# Altium schematic sheet PSOC_ControllerSchDoc.SchDoc
size A3; SheetNumber: 3; SheetTotal: 7
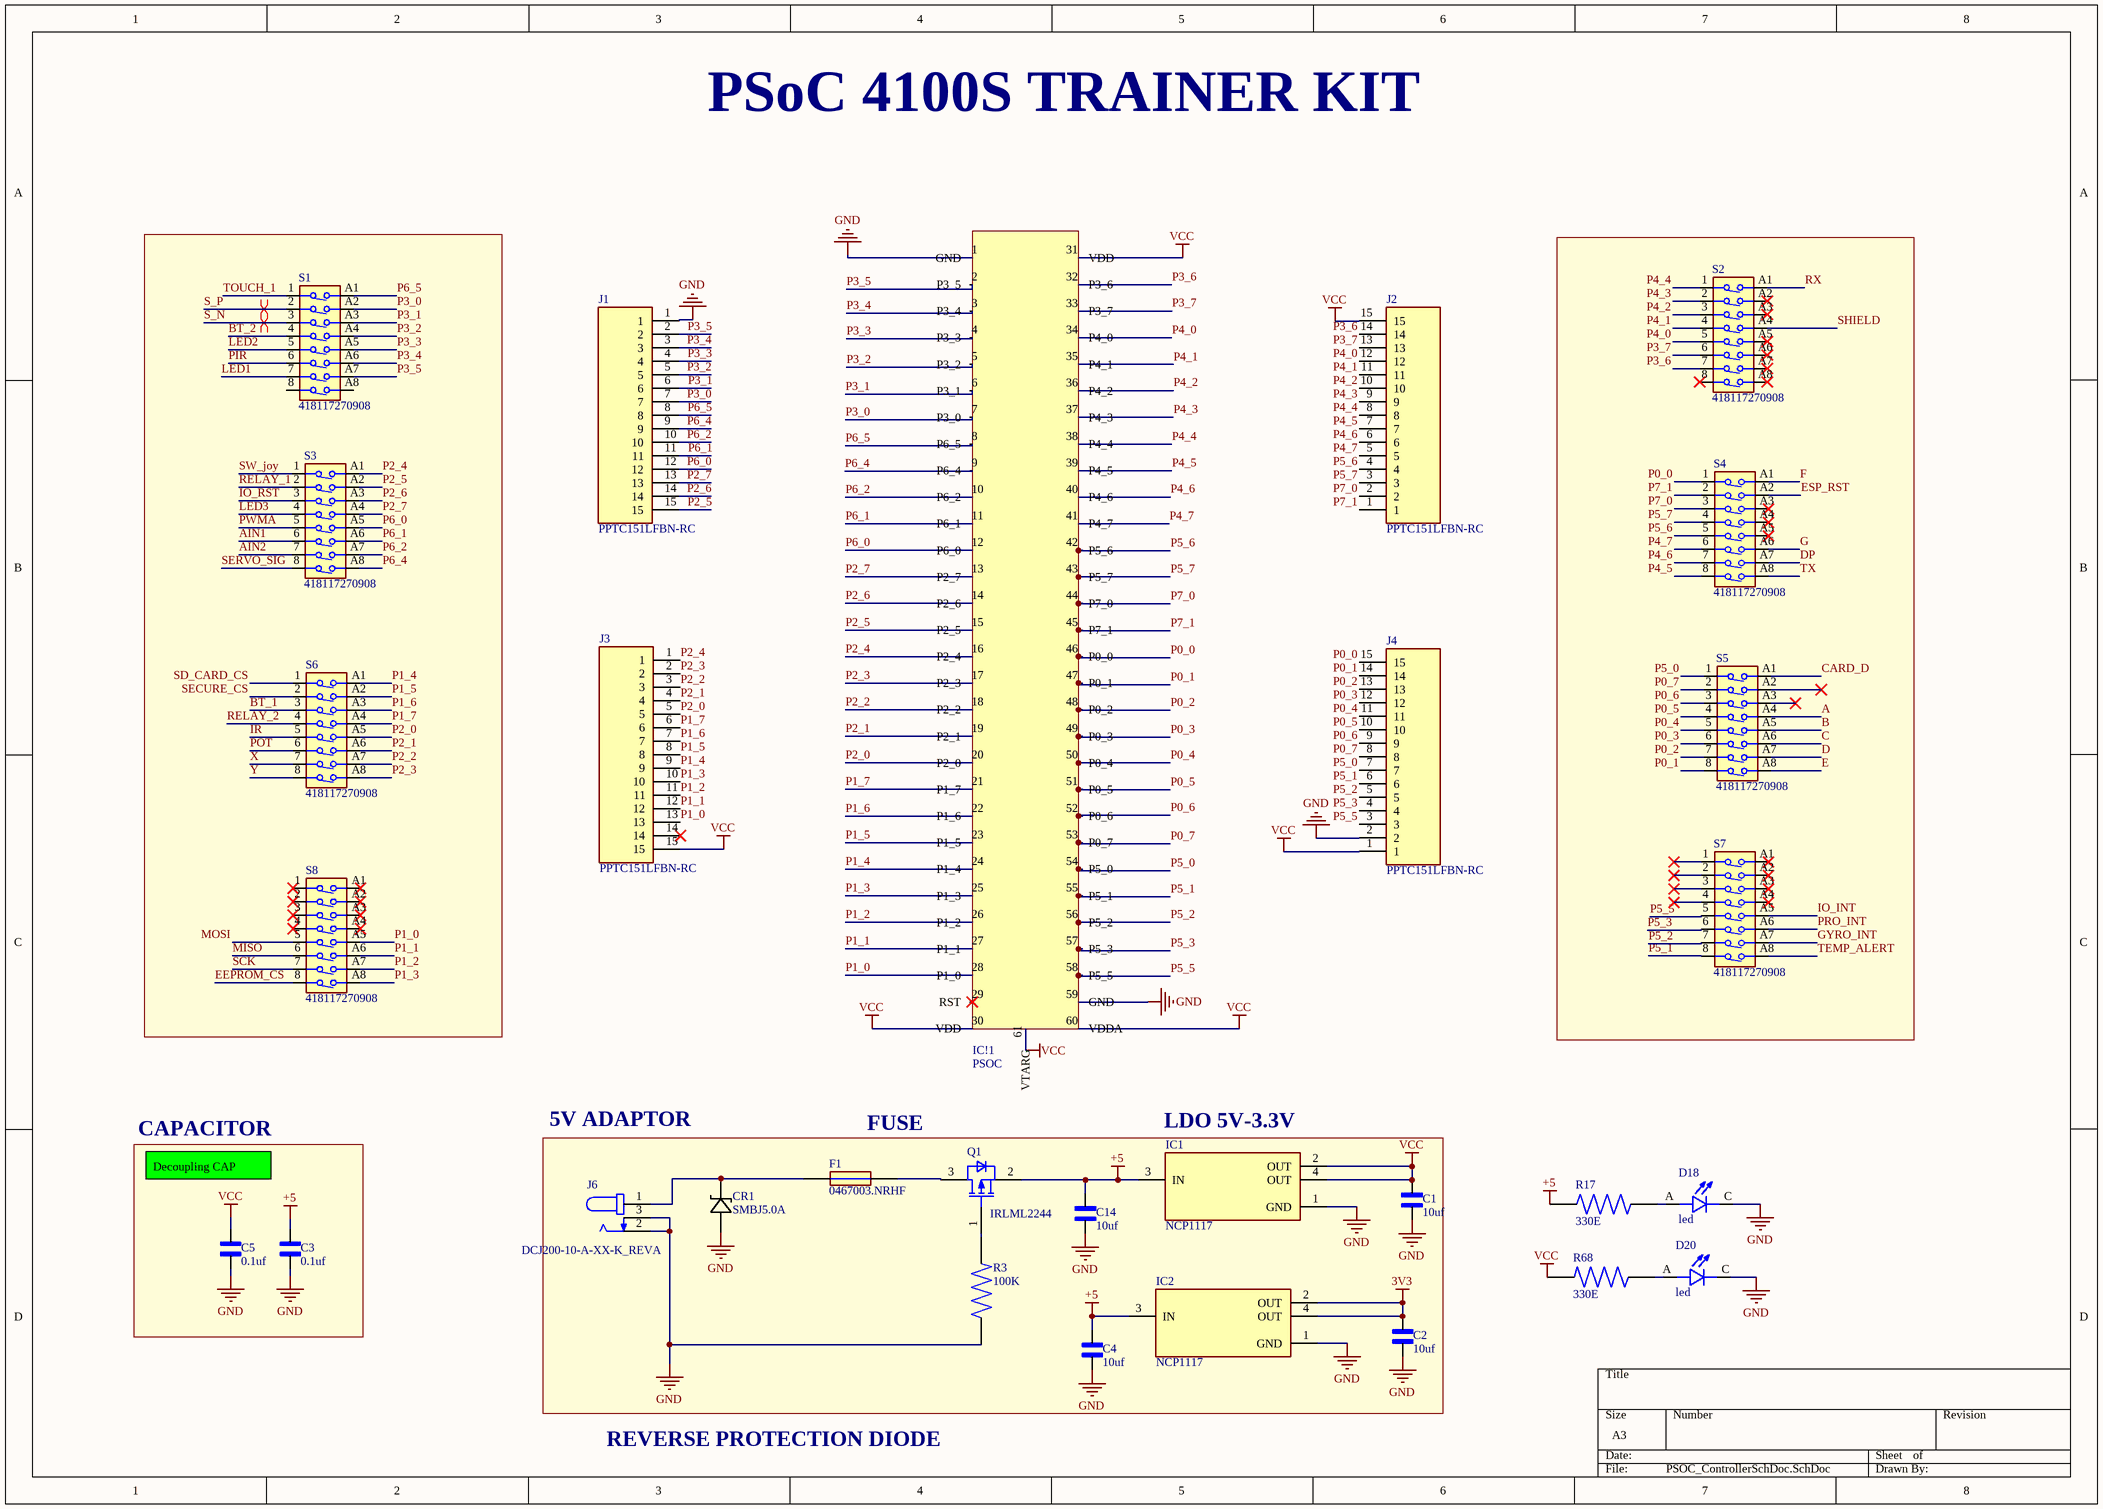
[diagram p0: PSOC_ControllerSchDoc.SchDoc]

## Parts
C1  10uf  [CAPC3216X229N]
C2  10uf  [CAPC3216X229N]
C3  0.1uf  [CAPC1005X55N]
C4  10uf  [CAPC3216X229N]
C5  0.1uf  [CAPC1005X55N]
C14  10uf  [CAPC3216X229N]
CR1  SMBJ5.0A  [DO-214AASMB_J-BEND_LTF]
D18  led  [LEDC2012X120N]
D20  led  [LEDC2012X120N]
F1  0467003.NRHF  [FUSC1608X43N]
IC1  NCP1117  [SOT223-3]
IC2  NCP1117  [SOT223-3]
IC!1  PSOC  [PCBComponent_1]
J1  PPTC151LFBN-RC  [RHDR15W85P0X254_1X15_3708X254X850P]
J2  PPTC151LFBN-RC  [RHDR15W85P0X254_1X15_3708X254X850P]
J3  PPTC151LFBN-RC  [RHDR15W85P0X254_1X15_3708X254X850P]
J4  PPTC151LFBN-RC  [RHDR15W85P0X254_1X15_3708X254X850P]
J6  DCJ200-10-A-XX-K_REVA  [GCT_DCJ200-10-A-XX-K_REVA]
Q1  IRLML2244  [SOT95P230X110-3N]
R3  100K  [RESC1005X40N]
R17  330E  [RESC1005X40N]
R68  330E  [RESC1005X40N]
S1  418117270908  [418117270908]
S2  418117270908  [418117270908]
S3  418117270908  [418117270908]
S4  418117270908  [418117270908]
S5  418117270908  [418117270908]
S6  418117270908  [418117270908]
S7  418117270908  [418117270908]
S8  418117270908  [418117270908]

## Blocks framed on the sheet
CAPACITOR: C3 C5

## Nets
3V3: C2.2 IC2.2(OUT) IC2.4(OUT)
+5: C3.1 C4.2 C14.2 IC1.3(IN) IC2.3(IN) Q1.2(SOURCE) R17.2
GND: C1.1 C2.1 C3.2 C4.1 C5.2 C14.1 CR1.2(ANODE) D18.C D20.C IC1.1(GND) IC2.1(GND) IC!1.1(GND) IC!1.59(GND) J1.1 J4.2 J6.2 J6.3 R3.2
VCC: C1.2 C5.1 IC1.2(OUT) IC1.4(OUT) IC!1.30(VDD) IC!1.31(VDD) IC!1.60(VDDA) IC!1.61(VTARG) J2.15 J3.15 J4.1 R68.2
A: S5.A4
AIN1: S3.6
AIN2: S3.7
B: S5.A5
BT_1: S6.3
BT_2: S1.4
C: S5.A6
CARD_D: S5.A1
D: S5.A7
DP: S4.A7
E: S5.A8
EEPROM_CS: S8.8
ESP_RST: S4.A2
F: S4.A1
G: S4.A6
GYRO_INT: S7.A7
IO_INT: S7.A5
IO_RST: S3.3
IR: S6.5
LED1: S1.7
LED2: S1.5
LED3: S3.4
MISO: S8.6
MOSI: S8.5
P0_0: IC!1.46(P0_0) J4.15 S4.1
P0_1: IC!1.47(P0_1) J4.14 S5.8
P0_2: IC!1.48(P0_2) J4.13 S5.7
P0_3: IC!1.49(P0_3) J4.12 S5.6
P0_4: IC!1.50(P0_4) J4.11 S5.5
P0_5: IC!1.51(P0_5) J4.10 S5.4
P0_6: IC!1.52(P0_6) J4.9 S5.3
P0_7: IC!1.53(P0_7) J4.8 S5.2
P1_0: IC!1.28(P1_0) J3.13 S8.A5
P1_1: IC!1.27(P1_1) J3.12 S8.A6
P1_2: IC!1.26(P1_2) J3.11 S8.A7
P1_3: IC!1.25(P1_3) J3.10 S8.A8
P1_4: IC!1.24(P1_4) J3.9 S6.A1
P1_5: IC!1.23(P1_5) J3.8 S6.A2
P1_6: IC!1.22(P1_6) J3.7 S6.A3
P1_7: IC!1.21(P1_7) J3.6 S6.A4
P2_0: IC!1.20(P2_0) J3.5 S6.A5
P2_1: IC!1.19(P2_1) J3.4 S6.A6
P2_2: IC!1.18(P2_2) J3.3 S6.A7
P2_3: IC!1.17(P2_3) J3.2 S6.A8
P2_4: IC!1.16(P2_4) J3.1 S3.A1
P2_5: IC!1.15(P2_5) J1.15 S3.A2
P2_6: IC!1.14(P2_6) J1.14 S3.A3
P2_7: IC!1.13(P2_7) J1.13 S3.A4
P3_0: IC!1.7(P3_0) J1.7 S1.A2
P3_1: IC!1.6(P3_1) J1.6 S1.A3
P3_2: IC!1.5(P3_2) J1.5 S1.A4
P3_3: IC!1.4(P3_3) J1.4 S1.A5
P3_4: IC!1.3(P3_4) J1.3 S1.A6
P3_5: IC!1.2(P3_5) J1.2 S1.A7
P3_6: IC!1.32(P3_6) J2.14 S2.7
P3_7: IC!1.33(P3_7) J2.13 S2.6
P4_0: IC!1.34(P4_0) J2.12 S2.5
P4_1: IC!1.35(P4_1) J2.11 S2.4
P4_2: IC!1.36(P4_2) J2.10 S2.3
P4_3: IC!1.37(P4_3) J2.9 S2.2
P4_4: IC!1.38(P4_4) J2.8 S2.1
P4_5: IC!1.39(P4_5) J2.7 S4.8
P4_6: IC!1.40(P4_6) J2.6 S4.7
P4_7: IC!1.41(P4_7) J2.5 S4.6
P5_0: IC!1.54(P5_0) J4.7 S5.1
P5_1: IC!1.55(P5_1) J4.6 S7.8
P5_2: IC!1.56(P5_2) J4.5 S7.7
P5_3: IC!1.57(P5_3) J4.4 S7.6
P5_5: IC!1.58(P5_5) J4.3 S7.5
P5_6: IC!1.42(P5_6) J2.4 S4.5
P5_7: IC!1.43(P5_7) J2.3 S4.4
P6_0: IC!1.12(P6_0) J1.12 S3.A5
P6_1: IC!1.11(P6_1) J1.11 S3.A6
P6_2: IC!1.10(P6_2) J1.10 S3.A7
P6_4: IC!1.9(P6_4) J1.9 S3.A8
P6_5: IC!1.8(P6_5) J1.8 S1.A1
P7_0: IC!1.44(P7_0) J2.2 S4.3
P7_1: IC!1.45(P7_1) J2.1 S4.2
PIR: S1.6
POT: S6.6
PRO_INT: S7.A6
PWMA: S3.5
RELAY_1: S3.2
RELAY_2: S6.4
RX: S2.A1
S_N: S1.3
S_P: S1.2
SCK: S8.7
SD_CARD_CS: S6.1
SECURE_CS: S6.2
SERVO_SIG: S3.8
SHIELD: S2.A4
SW_joy: S3.1
TEMP_ALERT: S7.A8
TOUCH_1: S1.1
TX: S4.A8
X: S6.7
Y: S6.8
NetCR1_1: CR1.1(CATHODE) F1.2 J6.1
NetD18_A: D18.A R17.1
NetD20_A: D20.A R68.1
NetF1_1: F1.1 Q1.3(DRAIN)
NetQ1_1: Q1.1(GATE) R3.1

Not connected (* = marked no-connect by the designer): IC!1 29(RST)*; J3 14*; S1 8 A8; S2 8* A2* A3* A5* A6* A7* A8*; S4 A3* A4* A5*; S5 A2* A3*; S7 1* 2* 3* 4* A1* A2* A3* A4*; S8 1* 2* 3* 4* A1* A2* A3* A4*

## Layout directives
differential pair: S_N, S_P

## Notes on the sheet
- PSoC 4100S TRAINER KIT
- 5V ADAPTOR
- Decoupling CAP
- (near F1) FUSE
- (near IC1) LDO 5V-3.3V
- REVERSE PROTECTION DIODE

## Library data of the parts
C1 C2 C4 C14 = 1206ZD226MAT2A: 0,1 ÂµF Â±%10 16V Seramik KondansatÃ¶r X7R 0402 (1005 Metrik); MF: AVX; SnapEDA_Link: https://www.snapeda.com/parts/1206ZD226MAT2A/AVX/view-part/?ref=snap; Package: 3216 AVX; Value: *; MP: 1206ZD226MAT2A; Check_prices: https://www.snapeda.com/parts/1206ZD226MAT2A/AVX/view-part/?ref=eda
C3 C5 = C0402T104K4RACTU: Cap Ceramic 0.1uF 16V X7R 10% SMD 0402 85Â°C Punched Paper T/R; MF: KEMET; SnapEDA_Link: https://www.snapeda.com/parts/C0402T104K4RACTU/KEMET/view-part/?ref=snap; Package: 0402 KEMET; Value: *; MP: C0402T104K4RACTU; Check_prices: https://www.snapeda.com/parts/C0402T104K4RACTU/KEMET/view-part/?ref=eda
CR1 = SMBJ5.0A: Description; Manufacturer_Name: Littelfuse Inc; Copyright: Copyright (C) 2026 Ultra Librarian. All rights reserved.; Manufacturer_Part_Number: SMBJ5.0A
D18 D20 = SML-LXT0805IW-TR: LED;Red;11mcd;0.061In.Dia.;SMD;100mA;2V Vf;635nm;140deg;SMD;White Diffused;5V Vr | Lumex SML-LXT0805IW-TR; MF: Lumex Opto/Components; SnapEDA_Link: https://www.snapeda.com/parts/SML-LXT0805IW-TR/Lumex+Opto%252FComponents+Inc./view-part/?ref=snap; Package: 0805 Lumex; Value: *; MP: SML-LXT0805IW-TR; Check_prices: https://www.snapeda.com/parts/SML-LXT0805IW-TR/Lumex+Opto%252FComponents+Inc./view-part/?ref=eda
F1 = 0467001.NRHF: Surface Mount Fuses 32V 0603 1A V/FA HALIDE FREE; Manufacturer_Name: LITTELFUSE; Geometry.Height: 0.432mm; Mouser Part Number: 576-0467001.NRHF; Mouser Price/Stock: https://www.mouser.co.uk/ProductDetail/Littelfuse/0467001NRHF?qs=n5MbhIql%252BRmX3ko2b0IFNg%3D%3D; Manufacturer_Part_Number: 0467001.NRHF; Datasheet Link: *
IC1 IC2 = NCP1117: Linear Voltage Regulator IC Positive Fixed 1 Output 1A SOT-223; MF: ON Semiconductor; SnapEDA_Link: https://www.snapeda.com/parts/NCP1117/Onsemi/view-part/?ref=snap; Package: None; Value: *; MP: NCP1117; Check_prices: https://www.snapeda.com/parts/NCP1117/Onsemi/view-part/?ref=eda
J1-J4 = PPTC151LFBN-RC: CONN HDR 15POS 0.1 TIN PCB; Manufacturer_Name: Sullins; Geometry.Height: 8.5mm; Manufacturer_Part_Number: PPTC151LFBN-RC; Mouser Part Number: *; Mouser Price/Stock: *; Arrow Part Number: *; Arrow Price/Stock: *; Datasheet Link: https://www.digikey.com/en/products/detail/sullins-connector-solutions/PPTC151LFBN-RC/810153
J6 = DCJ200-10-A-XX-K_REVA: Power Barrel Connector Jack 2.05mm ID (0.081), 5.50mm OD (0.217) Through Hole, Right Angle; MF: Global Connector Technology; MP: DCJ200-10-A-K1-K; SnapEDA_Link: https://www.snapeda.com/parts/DCJ200-10-A-K1-K/Global+Connector+Technology/view-part/?ref=snap; Package: None; Value: *; Check_prices: https://www.snapeda.com/parts/DCJ200-10-A-K1-K/Global+Connector+Technology/view-part/?ref=eda
Q1 = IRLML2244: Insulated-Gate Field-Effect Transistor (IGFET), P-Channel, Enhancement,  Body Diode, Pin 1 Gate, 2 Source, 3 Drain, 3 Pins; Manufacturer: Infineon Technologies; PackageReference: PG-SOT23-3-901; Manufacturer Order Number: IRLML2244
R3 R17 R68 = RL0402FR-070R1L: 100 mOhms Â±1% 0.063W, 1/16W Chip Resistor 0402 (1005 Metric) Automotive AEC-Q200, Current Sense, Moisture Resistant Thick Film; MF: Yageo; SnapEDA_Link: https://www.snapeda.com/parts/RL0402FR-070R1L/Yageo/view-part/?ref=snap; Package: 0402-2 Yageo; Value: *; MP: RL0402FR-070R1L; Check_prices: https://www.snapeda.com/parts/RL0402FR-070R1L/Yageo/view-part/?ref=eda
S1-S8 = 418117270908: Dip Switch SPST 8 Position Through Hole Slide (Standard) Actuator 25mA 24VDC; MF: WÃ¼rth Elektronik; SnapEDA_Link: https://www.snapeda.com/parts/418117270908/W%25C3%25BCrth+Elektronik+Midcom/view-part/?ref=snap; Package: None; Value: *; MP: 418117270908; Check_prices: https://www.snapeda.com/parts/418117270908/W%25C3%25BCrth+Elektronik+Midcom/view-part/?ref=eda